# Altium schematic sheet Board_Schem_USB_Micro.SchDoc
size A4; SheetNumber: 1; SheetTotal: 2
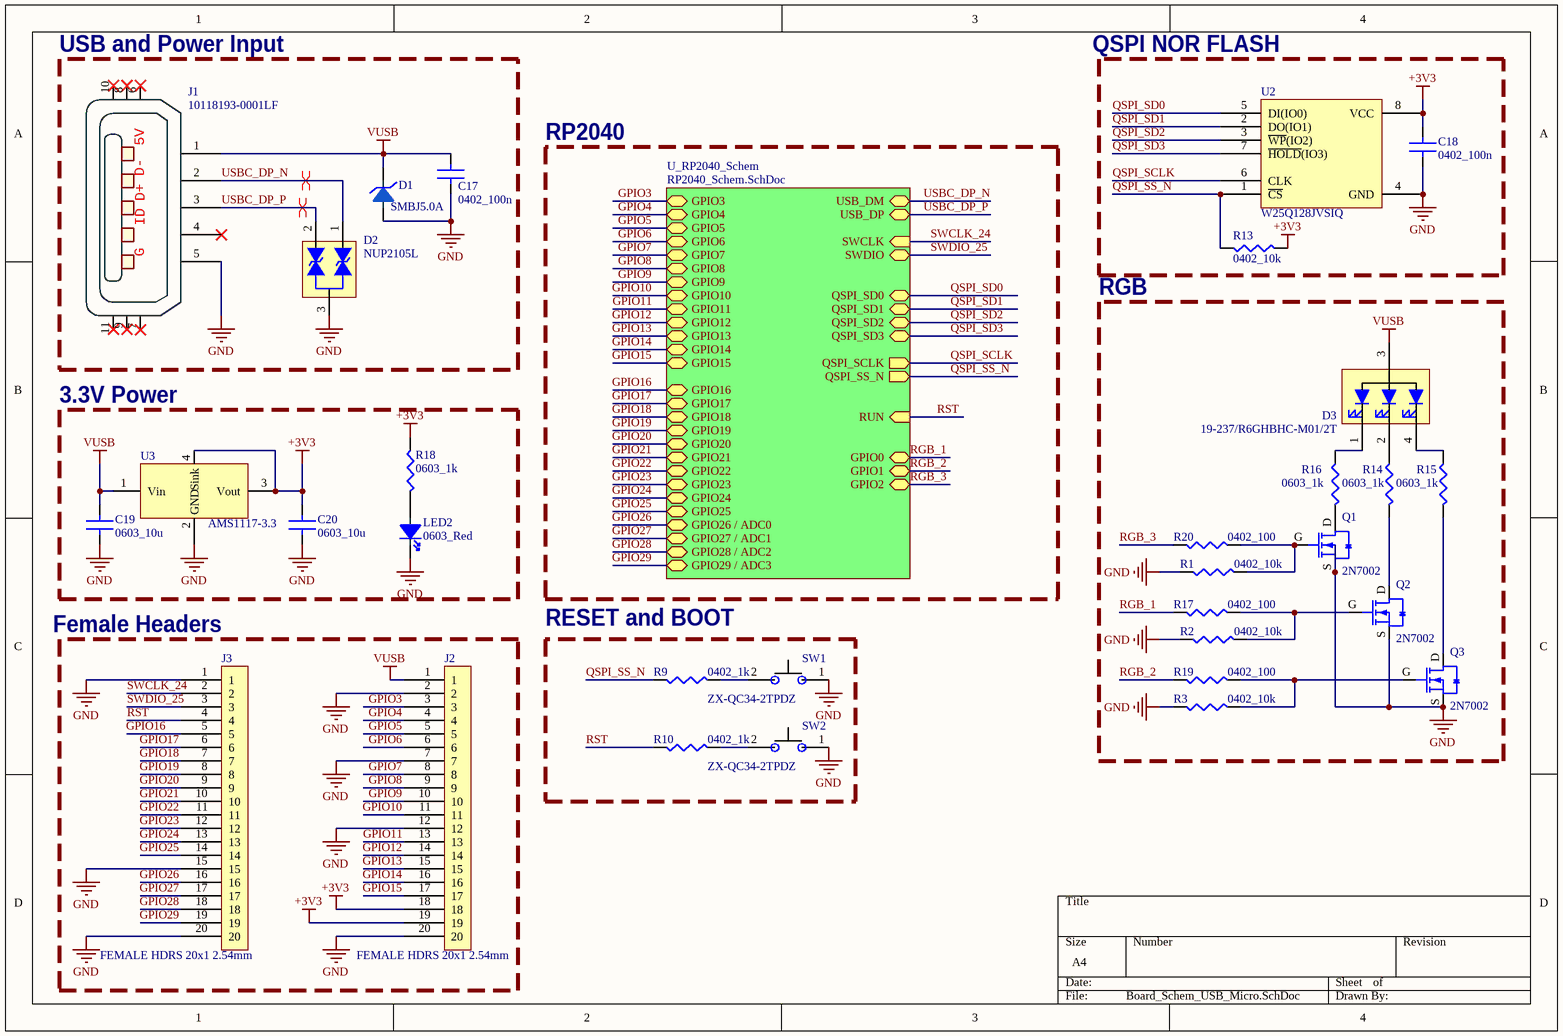
[diagram p0: Board_Schem_USB_Micro.SchDoc]

## Parts
C17  0402_100n  [0402]
C18  0402_100n  [0402]
C19  0603_10u  [0603_CAP]
C20  0603_10u  [0603_CAP]
D1  SMBJ5.0A  [D0-214AA]
D2  NUP2105L  [SO-23]
D3  19-237/R6GHBHC-M01/2T  [19-237/R6GHBHC-M01/2T]
J1  10118193-0001LF  [Micro USB]
J2  FEMALE HDRS 20x1 2.54mm  [FHDR 1x20 2.54mm]
J3  FEMALE HDRS 20x1 2.54mm  [FHDR 1x20 2.54mm]
LED2  0603_Red  [0603_LED]
Q1  2N7002  [SO-23 - MOSFET]
Q2  2N7002  [SO-23 - MOSFET]
Q3  2N7002  [SO-23 - MOSFET]
R1  0402_10k  [0402]
R2  0402_10k  [0402]
R3  0402_10k  [0402]
R9  0402_1k  [0402]
R10  0402_1k  [0402]
R13  0402_10k  [0402]
R14  0603_1k  [0603_CAP]
R15  0603_1k  [0603_CAP]
R16  0603_1k  [0603_CAP]
R17  0402_100  [0402]
R18  0603_1k  [0603_CAP]
R19  0402_100  [0402]
R20  0402_100  [0402]
SW1  ZX-QC34-2TPDZ  [2padSMD- 2*3*4]
SW2  ZX-QC34-2TPDZ  [2padSMD- 2*3*4]
U2  W25Q128JVSIQ  [SOIC-8]
U3  AMS1117-3.3  [SOT-223]

## Blocks framed on the sheet
USB and Power Input: C17 D1 D2 J1
RGB: D3 Q1-Q3 R1-R3 R14-R17 R19 R20
3.3V Power: C19 C20 LED2 R18 U3
RESET and BOOT: R9 R10 SW1 SW2

## Sub-sheets
U_RP2040_Schem = RP2040_Schem.SchDoc: GPIO0 (bidir), GPIO1 (bidir), GPIO2 (bidir), GPIO3 (bidir), GPIO4 (bidir), GPIO5 (bidir), GPIO6 (bidir), GPIO7 (bidir), GPIO8 (bidir), GPIO9 (bidir), GPIO10 (bidir), GPIO11 (bidir), GPIO12 (bidir), GPIO13 (bidir), GPIO14 (bidir), GPIO15 (bidir), GPIO16 (bidir), GPIO17 (bidir), GPIO18 (bidir), GPIO19 (bidir), GPIO20 (bidir), GPIO21 (bidir), GPIO22 (bidir), GPIO23 (bidir), GPIO24 (bidir), GPIO25 (bidir), GPIO26 / ADC0 (bidir), GPIO27 / ADC1 (bidir), GPIO28 / ADC2 (bidir), GPIO29 / ADC3 (bidir), USB_DM (bidir), USB_DP (bidir), RUN (in), SWDIO (bidir), SWCLK (in), QSPI_SD0 (bidir), QSPI_SCLK (out), QSPI_SS_N (out), QSPI_SD1 (bidir), QSPI_SD2 (bidir), QSPI_SD3 (bidir)

## Nets
+3V3: C18.2 C20.2 J2.18 J2.19 R13.1 R18.2 U2.8(VCC) U3.3(Vout) U3.4(Sink)
GND: C17.1 C18.1 C19.1 C20.1 D1.A(Anode) D2.3(IN3) J1.5 J2.2 J2.7 J2.12 J2.20 J3.1 J3.15 J3.20 LED2.2(Cathode) Q1.S Q2.S Q3.S R1.1 R2.1 R3.1 SW1.1 SW2.1 U2.4(GND) U3.2(GND)
VUSB: C17.2 C19.2 D1.K(Cathode) D3.3 J1.1 J2.1 U3.1(Vin)
GPIO3: J2.3 ; sheet U_RP2040_Schem/GPIO3
GPIO4: J2.4 ; sheet U_RP2040_Schem/GPIO4
GPIO5: J2.5 ; sheet U_RP2040_Schem/GPIO5
GPIO6: J2.6 ; sheet U_RP2040_Schem/GPIO6
GPIO7: J2.8 ; sheet U_RP2040_Schem/GPIO7
GPIO8: J2.9 ; sheet U_RP2040_Schem/GPIO8
GPIO9: J2.10 ; sheet U_RP2040_Schem/GPIO9
GPIO10: J2.11 ; sheet U_RP2040_Schem/GPIO10
GPIO11: J2.13 ; sheet U_RP2040_Schem/GPIO11
GPIO12: J2.14 ; sheet U_RP2040_Schem/GPIO12
GPIO13: J2.15 ; sheet U_RP2040_Schem/GPIO13
GPIO14: J2.16 ; sheet U_RP2040_Schem/GPIO14
GPIO15: J2.17 ; sheet U_RP2040_Schem/GPIO15
GPIO16: J3.5 ; sheet U_RP2040_Schem/GPIO16
GPIO17: J3.6 ; sheet U_RP2040_Schem/GPIO17
GPIO18: J3.7 ; sheet U_RP2040_Schem/GPIO18
GPIO19: J3.8 ; sheet U_RP2040_Schem/GPIO19
GPIO20: J3.9 ; sheet U_RP2040_Schem/GPIO20
GPIO21: J3.10 ; sheet U_RP2040_Schem/GPIO21
GPIO22: J3.11 ; sheet U_RP2040_Schem/GPIO22
GPIO23: J3.12 ; sheet U_RP2040_Schem/GPIO23
GPIO24: J3.13 ; sheet U_RP2040_Schem/GPIO24
GPIO25: J3.14 ; sheet U_RP2040_Schem/GPIO25
GPIO26: J3.16 ; sheet U_RP2040_Schem/GPIO26 / ADC0
GPIO27: J3.17 ; sheet U_RP2040_Schem/GPIO27 / ADC1
GPIO28: J3.18 ; sheet U_RP2040_Schem/GPIO28 / ADC2
GPIO29: J3.19 ; sheet U_RP2040_Schem/GPIO29 / ADC3
QSPI_SCLK: U2.6(CLK) ; sheet U_RP2040_Schem/QSPI_SCLK
QSPI_SD0: U2.5(DI(IO0)) ; sheet U_RP2040_Schem/QSPI_SD0
QSPI_SD1: U2.2(DO(IO1)) ; sheet U_RP2040_Schem/QSPI_SD1
QSPI_SD2: U2.3(~{WP}(IO2)) ; sheet U_RP2040_Schem/QSPI_SD2
QSPI_SD3: U2.7(~{HOLD}(IO3)) ; sheet U_RP2040_Schem/QSPI_SD3
QSPI_SS_N: R9.2 R13.2 U2.1(~{CS}) ; sheet U_RP2040_Schem/QSPI_SS_N
RGB_1: R17.1 ; sheet U_RP2040_Schem/GPIO0
RGB_2: R19.1 ; sheet U_RP2040_Schem/GPIO1
RGB_3: R20.1 ; sheet U_RP2040_Schem/GPIO2
RST: J3.4 R10.2 ; sheet U_RP2040_Schem/RUN
SWCLK_24: J3.2 ; sheet U_RP2040_Schem/SWCLK
SWDIO_25: J3.3 ; sheet U_RP2040_Schem/SWDIO
USBC_DP_N: D2.1(IN1) J1.2 ; sheet U_RP2040_Schem/USB_DM
USBC_DP_P: D2.2(IN2) J1.3 ; sheet U_RP2040_Schem/USB_DP
NetD3_1: D3.1 R16.2
NetD3_2: D3.2 R14.2
NetD3_4: D3.4 R15.2
NetLED2_1: LED2.1(Anode) R18.1
NetQ1_D: Q1.D R16.1
NetQ1_G: Q1.G R1.2 R20.2
NetQ2_D: Q2.D R14.1
NetQ2_G: Q2.G R2.2 R17.2
NetQ3_D: Q3.D R15.1
NetQ3_G: Q3.G R3.2 R19.2
NetR9_1: R9.1 SW1.2
NetR10_1: R10.1 SW2.2

Not connected (* = marked no-connect by the designer): J1 4* 6* 7* 8* 9* 10* 11*

## Layout directives
differential pair: USBC_DP_N, USBC_DP_P

## Notes on the sheet
- QSPI NOR FLASH
- RP2040
- (near J3) Female Headers
- (in symbol 10118193-0001LF) 5V; D-; D+; ID; G

## Library data of the parts
C17 C18 = 0402 Capacitor
C19 C20 = 0603 Capacitor
D2 = NUP2105L: ESD Protection Dual Diode for CAN Bus Line Protection
D3 = 19-237/R6GHBHC-M01/2T: Red, Green, Blue (RGB) 624nm Red, 525nm Green, 470nm Blue LED Indication - Discrete 1.8V Red, 2.65V Green, 2.75V Blue 0606 (1616 Metric)
J1 = 10118193-0001LF: CONN USB MICRO B RECPT SMT R/A; Manufacturer 1: Amphenol FCI; Parameter Name 1: Tape and Reel; Gender: Female; Connector Type: USB,Receptacle; Number of Contacts: 5; Number of Ports: 1; Current Rating: 1.8A; Insulation Resistance: 1GR; Max Voltage Rating (AC): 100V; Pitch: 0.65mm; Supplier 1: Digi-Key; Manufacturer Part Number 1: 10118193-0001LF; Stock 1: 49172; Pricing 1: 1=0.45000, 10=0.43000, 25=0.36840, 50=0.31320, 100=0.30090, 250=0.27016, 500=0.25788 (USD); RoHS: Yes; Mount: Surface Mount,Horizontal; Contact Plating: Gold; Contact Material: Copper Alloy; Color: Black; Number of Terminals: 5; Housing Material: Polymer; Min Operating Temperature: -55°C; Max Operating Temperature: 85°C; Termination: Solder; Orientation: Right Angle; Package Quantity: 1200; Voltage Rating: 100V; Features: Shielded; Length: 7.86mm; Depth: 5.67mm; Radiation Hardening: No; Flammability Rating: UL94 V-0; ComponentLink1URL: https://datasheet.ciiva.com/851/10118193-851106.pdf?src-supplier=Digi-Key; ComponentLink1Description: https://datasheet.ciiva.com/851/10118193-851106.pdf?src-supplier=Digi-Key; ComponentLink2URL: https://datasheet.ciiva.com/26853/getdatasheetpartid-418618-26853893.pdf?src-supplier=Verical; ComponentLink2Description: https://datasheet.ciiva.com/26853/getdatasheetpartid-418618-26853893.pdf?src-supplier=Verical; ComponentLink3URL: https://datasheet.ciiva.com/4598/10118193ac-197151-4598799.pdf?src-supplier=Mouser; ComponentLink3Description: https://datasheet.ciiva.com/4598/10118193ac-197151-4598799.pdf?src-supplier=Mouser; ComponentLink4URL: https://datasheet.ciiva.com/14802/10118193-0001lf-webpage-14802386.pdf?src-supplier=Arrow+Electronics; ComponentLink4Description: https://datasheet.ciiva.com/14802/10118193-0001lf-webpage-14802386.pdf?src-supplier=Arrow+Electronics; ComponentLink5URL: https://datasheet.ciiva.com/851/10118193-851107.pdf?src-supplier=Digi-Key; ComponentLink5Description: https://datasheet.ciiva.com/851/10118193-851107.pdf?src-supplier=Digi-Key; ComponentLink6URL: https://datasheet.ciiva.com/851/10118193-851108.pdf?src-supplier=Digi-Key; ComponentLink6Description: https://datasheet.ciiva.com/851/10118193-851108.pdf?src-supplier=Digi-Key; ComponentLink7URL: https://datasheet.ciiva.com/14618/70236827-14618887.pdf?src-supplier=Allied+Electronics; ComponentLink7Description: https://datasheet.ciiva.com/14618/70236827-14618887.pdf?src-supplier=Allied+Electronics; Supplier Part Number 1: 609-4616-1-ND
J2 J3 = Female Header 1*20: Board-To-Board Connector, M20 Series, Through Hole, Receptacle, 20, 2.54 mm, Tin Plated Contacts
LED2 = 0603LED
Q1-Q3 = 2N7002: 2N7002 7002 N Channel MOSFET SMD 60V 115mA 225mW 7.5Ω@10V,500mA SOT-23
R1-R3 R9 R10 R13 R17 R19 R20 = 0402 Resistor
R14-R16 R18 = 0603 Resistor
SW1 SW2 = 2*3*4 SMD Button 2_Pads: SWITCH TACTILE SPST 260gf SMD
U2 = W25Q128JVSIQ: 3V 128M-BIT SERIAL FLASH MEMORY WITH DUAL/QUAD SPI
U3 = AMS1117 - 3V3: AMS1117-3.3 Checked Fixed Positive LDO Regulator, 3.3V, 1.3V Dropout, PDSO3 Voltage Regulators - Linear